# Altium schematic sheet Controller-Sheet.SchDoc
size A4; DocumentNumber: 6; SheetNumber: 6; SheetTotal: 8
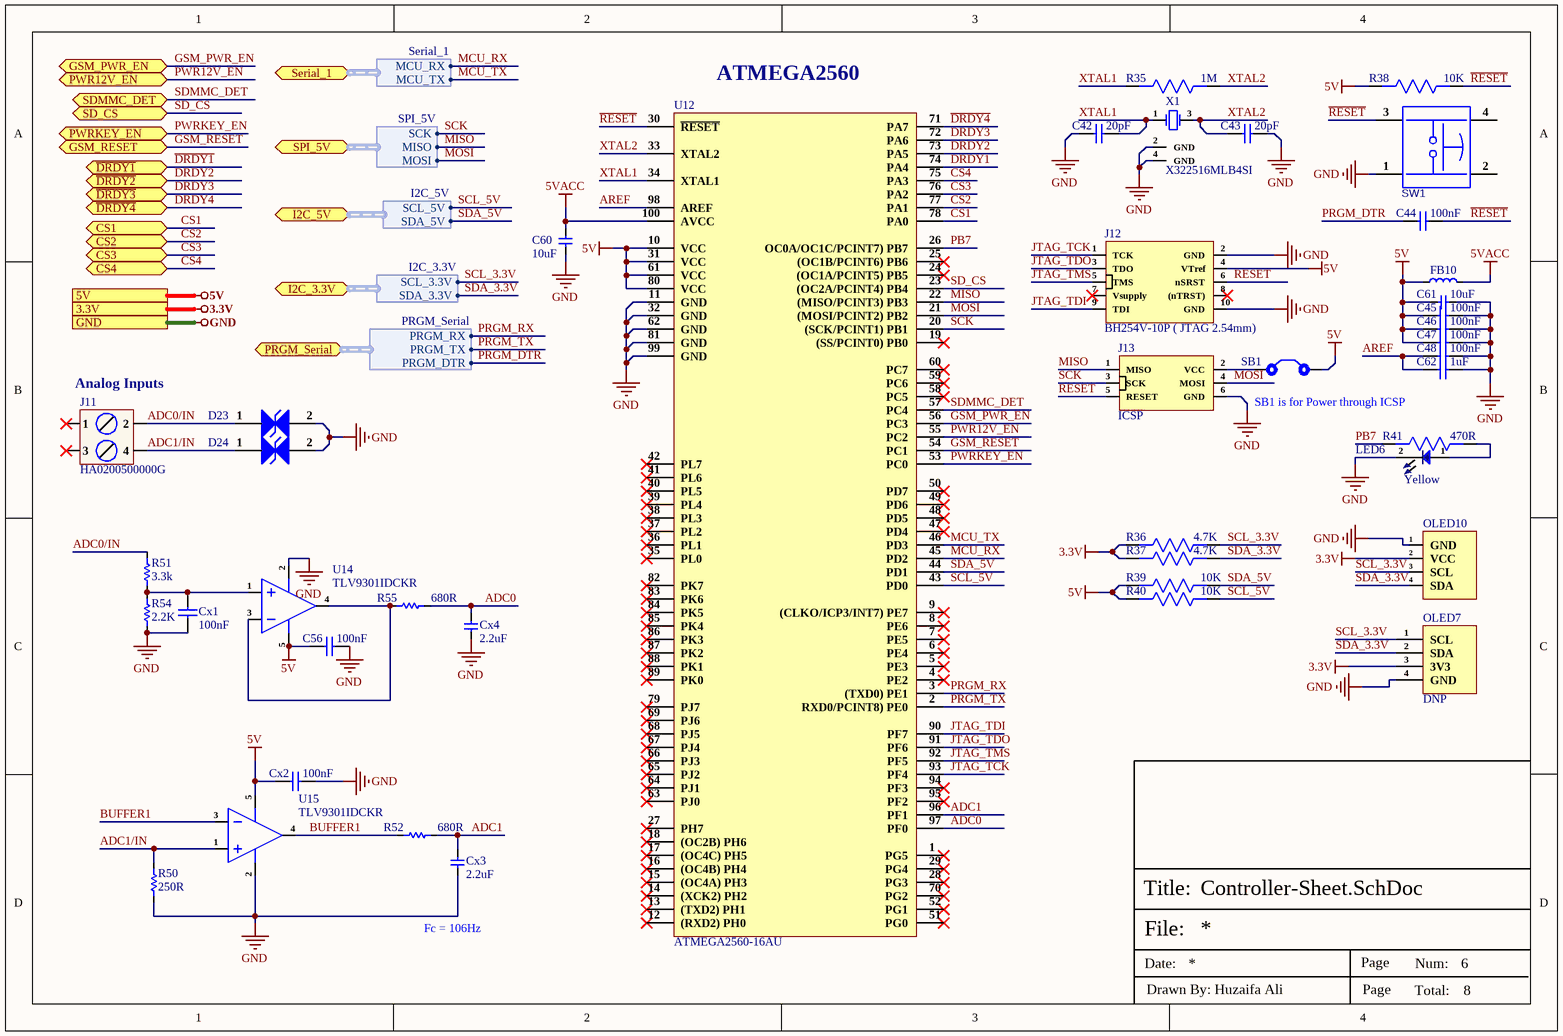
[diagram p0: Controller-Sheet.SchDoc]

## Parts
C42  20pF  [Cap-0603]
C43  20pF  [Cap-0603]
C44  100nF  [Cap-0603]
C45  100nF  [Cap-0603]
C46  100nF  [Cap-0603]
C47  100nF  [Cap-0603]
C48  100nF  [Cap-0603]
C56  100nF  [Cap-0603]
C60  10uF  [Cap-0603]
C61  10uF  [Cap-0603]
C62  1uF  [Cap-0603]
Cx1  100nF  [Cap-0603]
Cx2  100nF  [Cap-0603]
Cx3  2.2uF  [Cap-0805]
Cx4  2.2uF  [Cap-0805]
D23  PGB1010402KR  [Diode 0402]  (value not drawn)
D24  PGB1010402KR  [Diode 0402]  (value not drawn)
FB10  BLM15PD121SN1D  [IND-0402]  (value not drawn)
J11  HA0200500000G  [HA0200500000G]
J12  BH254V-10P ( JTAG 2.54mm)  [BH254V-10P]
J13  ICSP  [BH254V-6P]
LED6  Yellow  [LED-0603]
OLED7  DNP  [ZIO-101954]
OLED10  OLED 0.96" inch i2C  [OLED 0.96" inch i2C]  (value not drawn)
R35  1M  [Res-0603]
R36  4.7K  [Res-0603]
R37  4.7K  [Res-0603]
R38  10K  [Res-0603]
R39  10K  [Res-0603]
R40  10K  [Res-0603]
R41  470R  [Res-0603]
R50  250R  [Res-1206]
R51  3.3k  [Res-0603]
R52  680R  [Res-0603]
R54  2.2K  [Res-0603]
R55  680R  [Res-0603]
SB1  Solder Bridge  [Solder Bridge]  (value not drawn)
SW1  Tactile Switch  [TL3301NF160QG]  (value not drawn)
U12  ATMEGA2560-16AU  [TQFP-100(14x14)]
U14  TLV9301IDCKR  [SC-70-5]
U15  TLV9301IDCKR  [SC-70-5]
X1  X322516MLB4SI  [SMD3225-4P]

## Ports
3.3V, 5V, CS1 (bidir), CS2 (bidir), CS3 (bidir), CS4 (bidir), GND, GSM_PWR_EN (bidir), GSM_RESET (bidir), I2C_3.3V (bidir, harness I2C_3.3V), I2C_5V (bidir, harness I2C_5V), PRGM_Serial (bidir, harness PRGM_Serial), PWR12V_EN (bidir), PWRKEY_EN (bidir), SD_CS (bidir), SDMMC_DET (bidir), Serial_1 (bidir, harness Serial_1), SPI_5V (bidir, harness SPI_5V), ~{DRDY1} (bidir), ~{DRDY2} (bidir), ~{DRDY3} (bidir), ~{DRDY4} (bidir)

## Harnesses
I2C_3.3V: SCL_3.3V, SDA_3.3V
I2C_5V: SCL_5V, SDA_5V
SPI_5V: SCK, MISO, MOSI
PRGM_Serial: PRGM_RX, PRGM_TX, PRGM_DTR
Serial_1: MCU_RX, MCU_TX

## Nets
3.3V: OLED7.3(3V3) OLED10.2(VCC) R36.2 R37.2 ; port 3.3V
5V: C45.1 C46.1 C47.1 C56.1 C61.2 Cx2.1 FB10.1 J12.4(VTref) R38.2 R39.2 R40.2 SB1.2 U12.10(VCC) U12.31(VCC) U12.61(VCC) U12.80(VCC) U14.5(V+) U15.5(V+) ; port 5V
5VACC: C60.1 FB10.2 U12.100(AVCC)
GND: C42.1 C43.2 C45.2 C46.2 C47.2 C48.2 C56.2 C60.2 C61.1 C62.2 Cx1.1 Cx2.2 Cx3.1 Cx4.1 D23.2 D24.2 J12.2(GND) J12.10(GND) J13.6(GND) LED6.2 OLED7.4(GND) OLED10.1(GND) R50.1 R54.1 SW1.1 U12.11(GND) U12.32(GND) U12.62(GND) U12.81(GND) U12.99(GND) U14.2(V-) U15.2(V-) X1.2(GND) X1.4(GND) ; port GND
ADC0: Cx4.2 R55.2 U12.97(PF0)
ADC0/IN: D23.1 J11.2 R51.2
ADC1: Cx3.2 R52.2 U12.96(PF1)
ADC1/IN: D24.1 J11.4 R50.2 U15.1(IN+)
AREF: C48.1 C62.1 U12.98(AREF)
BUFFER1: R52.1 U15.3(IN-) U15.4(OUT)
CS1: U12.78(PA0) ; port CS1
CS2: U12.77(PA1) ; port CS2
CS3: U12.76(PA2) ; port CS3
CS4: U12.75(PA3) ; port CS4
~{DRDY1}: U12.74(PA4) ; port ~{DRDY1}
~{DRDY2}: U12.73(PA5) ; port ~{DRDY2}
~{DRDY3}: U12.72(PA6) ; port ~{DRDY3}
~{DRDY4}: U12.71(PA7) ; port ~{DRDY4}
GSM_PWR_EN: U12.56(PC3) ; port GSM_PWR_EN
GSM_RESET: U12.54(PC1) ; port GSM_RESET
JTAG_TCK: J12.1(TCK) U12.93(PF4)
JTAG_TDI: J12.9(TDI) U12.90(PF7)
JTAG_TDO: J12.3(TDO) U12.91(PF6)
JTAG_TMS: J12.5(TMS) U12.92(PF5)
MCU_RX: U12.45(PD2) ; port Serial_1.MCU_RX
MCU_TX: U12.46(PD3) ; port Serial_1.MCU_TX
MISO: J13.1(MISO) U12.22((MISO/PCINT3)_PB3) ; port SPI_5V.MISO
MOSI: J13.4(MOSI) U12.21((MOSI/PCINT2)_PB2) ; port SPI_5V.MOSI
PB7: R41.2 U12.26(OC0A/OC1C/PCINT7)_PB7)
PRGM_DTR: C44.1 ; port PRGM_Serial.PRGM_DTR
PRGM_RX: U12.3((TXD0)_PE1) ; port PRGM_Serial.PRGM_RX
PRGM_TX: U12.2(RXD0/PCINT8)_PE0) ; port PRGM_Serial.PRGM_TX
PWR12V_EN: U12.55(PC2) ; port PWR12V_EN
PWRKEY_EN: U12.53(PC0) ; port PWRKEY_EN
~{RESET}: C44.2 J12.6(nSRST) J13.5(RESET) R38.1 SW1.3 U12.30(~{RESET})
SCK: J13.3(SCK) U12.20((SCK/PCINT1)_PB1) ; port SPI_5V.SCK
SCL_3.3V: OLED7.1(SCL) OLED10.3(SCL) R36.1 ; port I2C_3.3V.SCL_3.3V
SCL_5V: R40.1 U12.43(PD0) ; port I2C_5V.SCL_5V
SD_CS: U12.23((OC2A/PCINT4)_PB4) ; port SD_CS
SDA_3.3V: OLED7.2(SDA) OLED10.4(SDA) R37.1 ; port I2C_3.3V.SDA_3.3V
SDA_5V: R39.1 U12.44(PD1) ; port I2C_5V.SDA_5V
SDMMC_DET: U12.57(PC4) ; port SDMMC_DET
XTAL1: C42.2 R35.2 U12.34(XTAL1) X1.1(CRYSTAL)
XTAL2: C43.1 R35.1 U12.33(XTAL2) X1.3(CRYSTAL)
NetCx1_2: Cx1.2 R51.1 R54.2 U14.1(IN+)
NetJ13_2: J13.2(VCC) SB1.1
NetLED6_1: LED6.1 R41.1
NetR55_1: R55.1 U14.3(IN-) U14.4(OUT)

Not connected (* = marked no-connect by the designer): J11 1* 3*; J12 7(Vsupply)* 8((nTRST))*; SW1 2 4; U12 1(PG5)* 4(PE2)* 5(PE3)* 6(PE4)* 7(PE5)* 8(PE6)* 9((CLKO/ICP3/INT7)_PE7)* 12((RXD2)_PH0)* 13((TXD2)_PH1)* 14((XCK2)_PH2)* 15((OC4A)_PH3)* 16((OC4B)_PH4)* 17((OC4C)_PH5)* 18((OC2B)_PH6)* 19((SS/PCINT0)_PB0)* 24((OC1A/PCINT5)_PB5)* 25((OC1B/PCINT6)_PB6)* 27(PH7)* 28(PG3)* 29(PG4)* 35(PL0)* 36(PL1)* 37(PL2)* 38(PL3)* 39(PL4)* 40(PL5)* 41(PL6)* 42(PL7)* 47(PD4)* 48(PD5)* 49(PD6)* 50(PD7)* 51(PG0)* 52(PG1)* 58(PC5)* 59(PC6)* 60(PC7)* 63(PJ0)* 64(PJ1)* 65(PJ2)* 66(PJ3)* 67(PJ4)* 68(PJ5)* 69(PJ6)* 70(PG2)* 79(PJ7)* 82(PK7)* 83(PK6)* 84(PK5)* 85(PK4)* 86(PK3)* 87(PK2)* 88(PK1)* 89(PK0)* 94(PF3)* 95(PF2)*

## Notes on the sheet
- (near U12) ATMEGA2560
- (near J11) Analog Inputs
- SB1 is for Power through ICSP
- Fc = 106Hz
- File:
- Title:
- Date:
- Page
- Num:
- Total:
- Drawn By: Huzaifa Ali

## Library data of the parts
C42 C43 = CC0603JRNPO9BN200: CAP CER 20PF 50V C0G/NPO 0603; Manufacturer: Yageo; Tolerance: 5%; Dielectric: C0G; Supplier 1: Digi-Key; Manufacturer Part Number: CC0603JRNPO9BN200; Stock 1: 259568; Pricing 1: 1=0.1, 10=0.048, 100=0.0214, 500=0.01526, 1000=0.01198 (USD); Mount: Surface Mount; Case/Package: 0603; Number of Pins: 2; Weight: 7.1E-05oz; Case Code (Imperial): 0603; Case Code (Metric): 1608; Min Operating Temperature: -55°C; Max Operating Temperature: 125°C; Capacitance: 20pF; Package Quantity: 4000; Voltage Rating (DC): 50V; Packaging: Tape and Reel; Voltage Rating: 50V; Termination: SMD/SMT; Composition: Ceramic; Length: 1.6mm; Width: 0.8mm; Thickness: 0.035inch; Depth: 0.8mm; REACH SVHC: Unknown; Lead Free: Lead Free; ComponentLink1URL: http://www.farnell.com/datasheets/1132289.pdf?src-supplier=Element14; ComponentLink1Description: http://www.farnell.com/datasheets/1132289.pdf?src-supplier=Element14; ComponentLink2URL: http://www.yageo.com/documents/recent/UPY-GP_NP0_16V-to-50V_16.pdf?src-supplier=Digi-Key; ComponentLink2Description: http://www.yageo.com/documents/recent/UPY-GP_NP0_16V-to-50V_16.pdf?src-supplier=Digi-Key; Supplier Part Number 1: 311-1424-6-ND; LCSC Part Number: C105621
C44-C48 C56 Cx1 Cx2 = CC0603KRX5R9BB104: CAP CER 0.1UF 50V X5R 0603; Manufacturer: Yageo; Tolerance: 10%; Item Type: Capacitor; Supplier 1: Digi-Key; Manufacturer Part Number: CC0603KRX5R9BB104; RoHS: Yes; Category: Ceramic Capacitors; Stock 1: 152253; Pricing 1: 1=0.10000, 10=0.05200, 50=0.02820, 100=0.02310, 500=0.01648, 1000=0.01294 (USD); Mount: Surface Mount; Case/Package: 0603; Case Code (Imperial): 0603; Case Code (Metric): 1608; Weight: 7.1E-05oz; Min Operating Temperature: -55°C; Max Operating Temperature: 85°C; Capacitance: 100nF; Packaging: Tape and Reel; Voltage Rating: 50V; Dielectric: X5R; Termination: SMD/SMT; Voltage Rating (DC): 50V; Package Quantity: 4000; Length: 0.063inch; Width: 0.031inch; Thickness: 0.035inch; Lead Free: Lead Free; Halogen Free: Halogen Free; ComponentLink1URL: http://www.mouser.com/ds/2/447/Yageo_UPY-GP_NP0_16V-to-50V_9-358835.pdf?src-supplier=Mouser; ComponentLink1Description: http://www.mouser.com/ds/2/447/Yageo_UPY-GP_NP0_16V-to-50V_9-358835.pdf?src-supplier=Mouser; ComponentLink2URL: https://www.yageo.com/upload/media/product/productsearch/datasheet/mlcc/UPY-GPHC_X5R_4V-to-50V_26.pdf?src-supplier=Digi-Key; ComponentLink2Description: https://www.yageo.com/upload/media/product/productsearch/datasheet/mlcc/UPY-GPHC_X5R_4V-to-50V_26.pdf?src-supplier=Digi-Key; ComponentLink3URL: http://www.yageo.com/exep/pages/download/literatures/ProductSelectionGuide%202014_Final_2.pdf?src-supplier=Digi-Key; ComponentLink3Description: http://www.yageo.com/exep/pages/download/literatures/ProductSelectionGuide%202014_Final_2.pdf?src-supplier=Digi-Key; Supplier Part Number 1: 311-4046-1-ND; LCSC Part Number: C110022
C60 C61 = CC0603KRX5R7BB106: CAP CER 10UF 16V X5R 0603; Manufacturer: Yageo; Tolerance: 10%; Item Type: Capacitor; Supplier 1: Digi-Key; Manufacturer Part Number: CC0603KRX5R7BB106; RoHS: Yes; Category: Ceramic Capacitors; Stock 1: 240725; Pricing 1: 1=0.68000, 10=0.48000, 50=0.36300, 100=0.31610, 500=0.23416, 1000=0.19903 (USD); Mount: Surface Mount; Case/Package: 0603; Case Code (Imperial): 0603; Case Code (Metric): 1608; Min Operating Temperature: -55°C; Max Operating Temperature: 85°C; Packaging: Cut Tape; Capacitance: 10uF; Voltage Rating: 16V; RoHS Compliant: Yes; ComponentLink1URL: http://www.yageo.com/documents/recent/UPY-GPHC_X5R_4V-to-50V_25.pdf?src-supplier=Digi-Key; ComponentLink1Description: http://www.yageo.com/documents/recent/UPY-GPHC_X5R_4V-to-50V_25.pdf?src-supplier=Digi-Key; Supplier Part Number 1: 311-3486-1-ND; LCSC Part Number: C2936601
C62 = CC0603KRX5R8BB105: CAP CER 1UF 25V X5R 0603; Manufacturer: Yageo; Tolerance: 10%; Item Type: Capacitor; Supplier 1: Digi-Key; Manufacturer Part Number: CC0603KRX5R8BB105; RoHS: Yes; Category: Ceramic Capacitors; Stock 1: 919939; Pricing 1: 1=0.12000, 10=0.08400, 50=0.04760, 100=0.03940, 500=0.02764, 1000=0.02288 (USD); Mount: Surface Mount; Case/Package: 0603; Number of Pins: 2; Case Code (Metric): 1608; Case Code (Imperial): 0603; Min Operating Temperature: -55°C; Max Operating Temperature: 85°C; Capacitance: 1uF; Dielectric: X5R; Package Quantity: 1; Voltage Rating: 25V; Packaging: Tape and Reel; Termination: SMD/SMT; Voltage Rating (DC): 25V; Series: CC; Construction: Flat; Length: 1.6mm; Width: 0.031inch; Height: 0.8mm; Thickness: 0.035inch; Depth: 0.8mm; Radiation Hardening: No; REACH SVHC: No SVHC; Lead Free: Lead Free; Halogen Free: Halogen Free; RoHS Compliant: Yes; ComponentLink1URL: https://datasheet.ciiva.com/176/mlccorderingcode-176785.pdf?src-supplier=Digi-Key; ComponentLink1Description: https://datasheet.ciiva.com/176/mlccorderingcode-176785.pdf?src-supplier=Digi-Key; ComponentLink2URL: https://datasheet.ciiva.com/176/mlccorderingcode-176786.pdf?src-supplier=Digi-Key; ComponentLink2Description: https://datasheet.ciiva.com/176/mlccorderingcode-176786.pdf?src-supplier=Digi-Key; ComponentLink3URL: https://datasheet.ciiva.com/176/mlccorderingcode-176787.pdf?src-supplier=Digi-Key; ComponentLink3Description: https://datasheet.ciiva.com/176/mlccorderingcode-176787.pdf?src-supplier=Digi-Key; ComponentLink4URL: https://datasheet.ciiva.com/17436/upy-gphc-x5r-4v-to-50v-12-17436952.pdf?src-supplier=Avnet+Europe; ComponentLink4Description: https://datasheet.ciiva.com/17436/upy-gphc-x5r-4v-to-50v-12-17436952.pdf?src-supplier=Avnet+Europe; ComponentLink5URL: https://datasheet.ciiva.com/7978/1525783-7978171.pdf?src-supplier=Element14; ComponentLink5Description: https://datasheet.ciiva.com/7978/1525783-7978171.pdf?src-supplier=Element14; ComponentLink6URL: https://datasheet.ciiva.com/11586/upy-gphc-x5r-4v-to-50v-12-11586318.pdf?src-supplier=Avnet; ComponentLink6Description: https://datasheet.ciiva.com/11586/upy-gphc-x5r-4v-to-50v-12-11586318.pdf?src-supplier=Avnet; Supplier Part Number 1: 311-1445-1-ND; LCSC Part Number: C14664
Cx3 Cx4 = CC0805KKX5R9BB225: CAP CER 2.2UF 50V X5R 0805; Manufacturer: Yageo; Tolerance: 10%; Item Type: Capacitor; Supplier 1: Mouser; Manufacturer Part Number: CC0805KKX5R9BB225; RoHS: Yes; Category: Ceramic Capacitors; Stock 1: 3880; Pricing 1: 1=0.26000, 10=0.12100, 50=0.12100, 100=0.08700, 1000=0.06700, 10000=0.05000 (USD); Mounting Technology: Surface Mount; Case/Package: 0805; Case Code (Metric): 2012; Case Code (Imperial): 0805; Weight: 0.000194oz; Min Operating Temperature: -55°C; Max Operating Temperature: 85°C; Packaging: Tape and Reel; Value: 2.2uF; Voltage Rating: 50V; Dielectric: X5R; Termination: SMD/SMT; Resistor Type: Ceramic; Voltage Rating (DC): 50V; Package Quantity: 3000; Length: 0.079inch; Width: 1.25mm; Thickness: 0.057inch; Lead Free: Lead Free; Halogen Free: Halogen Free; RoHS Compliant: Yes; ComponentLink1URL: http://www.mouser.com/ds/2/447/Yageo_UPY-GP_NP0_16V-to-50V_9-358835.pdf?src-supplier=Mouser; ComponentLink1Description: http://www.mouser.com/ds/2/447/Yageo_UPY-GP_NP0_16V-to-50V_9-358835.pdf?src-supplier=Mouser; ComponentLink2URL: http://www.yageo.com/documents/recent/UPY-GPHC_X5R_4V-to-50V_25.pdf?src-supplier=Digi-Key; ComponentLink2Description: http://www.yageo.com/documents/recent/UPY-GPHC_X5R_4V-to-50V_25.pdf?src-supplier=Digi-Key; Supplier Part Number 1: 603-CC805KKX5R9BB225; LCSC Part Number: C326581
D23 D24 = PGB1010402KR: TVS DIODE 12VWM 250VC 0402; Manufacturer: Littelfuse; Direction: Bidirectional; Capacitance: 0.04pF; Number of Channels: 1; Reverse Standoff Voltage: 12V; Clamping Voltage: 250V; Power Line Protection: No; Leakage Current: 1nA; Element Configuration: Single; Diode Type: ZENER; Response Time: 1ns; Supplier 1: Arrow Electronics; Manufacturer Part Number: PGB1010402KR; RoHS: Yes; Category: TVS Diodes; Stock 1: 30000; Pricing 1: 10000=0.23580, 20000=0.23350, 30000=0.23120, 40000=0.22890, 50000=0.21590, 100000=0.20590 (USD); Mount: Surface Mount; Case/Package: 0402; Number of Pins: 2; Case Code (Metric): 1005; Case Code (Imperial): 0402; Min Operating Temperature: -65°C; Max Operating Temperature: 125°C; Packaging: Cut Tape; Number of Bidirectional Channels: 1; Termination: SMD/SMT; Working Voltage: 12V; Operating Supply Voltage: 12V; Resistor Type: Zener; Series: PulseGuard® PGB; Voltage Rating: 12V; Polarity: Bidirectional; Number of Elements: 1; Voltage Rating (DC): 12V; Length: 1.66mm; Height: 0.31mm; Depth: 0.51mm; Radiation Hardening: No; Lead Free: Lead Free; RoHS Compliant: Yes; Reach SVHC Compliant: Yes; ComponentLink1URL: https://datasheet.ciiva.com/1268/1486684-1268416.pdf?src-supplier=Element14; ComponentLink1Description: https://datasheet.ciiva.com/1268/1486684-1268416.pdf?src-supplier=Element14; ComponentLink2URL: https://datasheet.ciiva.com/5837/575761-5837954.pdf?src-supplier=Farnell; ComponentLink2Description: https://datasheet.ciiva.com/5837/575761-5837954.pdf?src-supplier=Farnell; ComponentLink3URL: https://datasheet.ciiva.com/11804/0900766b80f9ec73-11804302.pdf?src-supplier=RSComponents; ComponentLink3Description: https://datasheet.ciiva.com/11804/0900766b80f9ec73-11804302.pdf?src-supplier=RSComponents; ComponentLink4URL: https://datasheet.ciiva.com/1268/575761-1268268.pdf?src-supplier=Element14; ComponentLink4Description: https://datasheet.ciiva.com/1268/575761-1268268.pdf?src-supplier=Element14; ComponentLink5URL: https://datasheet.ciiva.com/331/littelfuse-pulseguard-esd-pgb1-331746.pdf?src-supplier=Digi-Key; ComponentLink5Description: https://datasheet.ciiva.com/331/littelfuse-pulseguard-esd-pgb1-331746.pdf?src-supplier=Digi-Key; ComponentLink6URL: https://datasheet.ciiva.com/331/littelfuse-pulseguard-esd-pgb1-331747.pdf?src-supplier=Digi-Key; ComponentLink6Description: https://datasheet.ciiva.com/331/littelfuse-pulseguard-esd-pgb1-331747.pdf?src-supplier=Digi-Key; ComponentLink7URL: https://datasheet.ciiva.com/331/littelfuse-pulseguard-esd-pgb1-331745.pdf?src-supplier=Digi-Key; ComponentLink7Description: https://datasheet.ciiva.com/331/littelfuse-pulseguard-esd-pgb1-331745.pdf?src-supplier=Digi-Key; ComponentLink8URL: https://datasheet.ciiva.com/26917/getdatasheetpartid-250436-26917930.pdf?src-supplier=Verical; ComponentLink8Description: https://datasheet.ciiva.com/26917/getdatasheetpartid-250436-26917930.pdf?src-supplier=Verical; Supplier Part Number 1: PGB1010402KR; LCSC Part Number: C10676; Item Type: Diode
FB10 = BLM15PD121SN1D: FERRITE BEAD 120 OHM 0402 1LN; Manufacturer: Murata; Material: Steel,Ferrite; Tolerance: 25%; Impedance: 120R; Current Rating: 1.3A; Number of Lines: 1; DC Resistance (DCR): 90mR; Test Frequency: 100MHz; Supplier 1: Avnet; Manufacturer Part Number: BLM15PD121SN1D; RoHS: Yes; Category: Ferrite Beads and Chips; Stock 1: 300000; Pricing 1: 10000=0.03238, 20000=0.03063, 40000=0.02888, 60000=0.02713, 80000=0.02538, 100000=0.02363, 1000000=0.02188 (USD); Case/Package: 0402; Number of Pins: 2; Core Material: Ferrite; Case Code (Metric): 1005; Case Code (Imperial): 0402; Min Operating Temperature: -55°C; Max Operating Temperature: 125°C; Package Quantity: 1; Packaging: Tape and Reel; Max Current Rating: 1.3A; Termination: SMD/SMT; Max DC Current: 1.3A; DC Current: 1.3A; Number of Circuits: 1; Series: BLM15PD; DC Resistance-Max: 90mR; Length: 1mm; Width: 0.5mm; Height: 0.5mm; Depth: 0.55mm; Radiation Hardening: No; Reach SVHC Compliant: Yes; Military Standard: Not; Lead Free: Lead Free; RoHS Compliant: Yes; ComponentLink1URL: https://datasheet.ciiva.com/11800/0900766b811b5866-11800860.pdf?src-supplier=RSComponents; ComponentLink1Description: https://datasheet.ciiva.com/11800/0900766b811b5866-11800860.pdf?src-supplier=RSComponents; ComponentLink2URL: https://datasheet.ciiva.com/18093/getdatasheetpartid-195858-18093157.pdf?src-supplier=Verical; ComponentLink2Description: https://datasheet.ciiva.com/18093/getdatasheetpartid-195858-18093157.pdf?src-supplier=Verical; ComponentLink3URL: https://datasheet.ciiva.com/41425/001171686-da-01-en-chip-drossel0402-120r-1300ma-1-0x0-5mm-41425776.pdf?src-supplier=Conrad; ComponentLink3Description: https://datasheet.ciiva.com/41425/001171686-da-01-en-chip-drossel0402-120r-1300ma-1-0x0-5mm-41425776.pdf?src-supplier=Conrad; ComponentLink4URL: https://datasheet.ciiva.com/41449/001172205-da-01-en-drossel-0402-120r-11-0x0-5mm-10000st-41449495.pdf?src-supplier=Conrad; ComponentLink4Description: https://datasheet.ciiva.com/41449/001172205-da-01-en-drossel-0402-120r-11-0x0-5mm-10000st-41449495.pdf?src-supplier=Conrad; ComponentLink5URL: https://datasheet.ciiva.com/1012/l0110e-1012435.pdf?src-supplier=Digi-Key; ComponentLink5Description: https://datasheet.ciiva.com/1012/l0110e-1012435.pdf?src-supplier=Digi-Key; ComponentLink6URL: https://datasheet.ciiva.com/1012/l0110e-1012434.pdf?src-supplier=Digi-Key; ComponentLink6Description: https://datasheet.ciiva.com/1012/l0110e-1012434.pdf?src-supplier=Digi-Key; ComponentLink7URL: https://datasheet.ciiva.com/1012/l0110e-1012436.pdf?src-supplier=Digi-Key; ComponentLink7Description: https://datasheet.ciiva.com/1012/l0110e-1012436.pdf?src-supplier=Digi-Key; Supplier Part Number 1: BLM15PD121SN1D; LCSC Part Number: C76891; Item Type: Ferrite Bead
J11 = HA0200500000G: TERM BLK 2POS TOP ENT 5.08MM PCB; Manufacturer: Amphenol; Item Type: Terminal Block; Supplier 1: Arrow Electronics; Manufacturer Part Number: HA0200500000G; RoHS: Yes; Stock 1: 120; Pricing 1: 2160=0.34600, 2520=0.34400, 3600=0.29460, 9000=0.29270, 18000=0.29070, 45000=0.28890, 90000=0.28680 (USD); Terminal and Terminal Block Type: BARRIER STRIP TERMINAL BLOCK; RoHS Compliant: Yes; Reach SVHC Compliant: Yes; ComponentLink1URL: https://datasheet.ciiva.com:443/pdfs/VipMasterIC/IC/AMPH/AMPH-S-A0005047712/AMPH-S-A0005047712-1.pdf?src-supplier=IHS+Markit; ComponentLink1Description: https://datasheet.ciiva.com:443/pdfs/VipMasterIC/IC/AMPH/AMPH-S-A0005047712/AMPH-S-A0005047712-1.pdf?src-supplier=IHS+Markit; Supplier Part Number 1: HA0200500000G; LCSC Part Number: C967080
J12 = BH254V-10P ( JTAG 2.54mm): 2.54mm -40℃~+105℃ Straight 3A 250V 5 Push - Pull 2.54mm 2 Plugin,P=2.54mm IDC Connectors ROHS; Manufacturer: XFCN; Manufacturer Part Number: BH254V-10P; Package: Plugin,P=2.54mm; LCSC Part Number: C492442; Item Type: Connector; ComponentLink1Description: LCSC; ComponentLink1URL: https://www.lcsc.com/product-detail/IDC-Connectors_XFCN-BH254V-10P_C492442.html
J13 = BH254V-6P ( 6-ICSP 2.54mm): 2.54mm -40℃~+105℃ Straight 3A 250V 3 Push - Pull 2.54mm 2 Plugin,P=2.54mm IDC Connectors ROHS; Manufacturer: XFCN; Manufacturer Part Number: BH254V-6P; Package: Plugin,P=2.54mm; LCSC Part Number: C492441; Item Type: Connector; ComponentLink1Description: LCSC; ComponentLink1URL: *https://www.lcsc.com/product-detail/IDC-Connectors_XFCN-BH254V-6P_C492441.html
LED6 = 19-21/G6C-FM1N2B/3T: Yellow-Green 572nm LED Indication - Discrete 2.05V 0603 (1608 Metric); Manufacturer: Everlight Elec; Manufacturer Part Number: 19-21/G6C-FM1N2B/3T; Package: 0603; LCSC Part Number: C93689; Item Type: LED; ComponentLink1Description: LCSC; ComponentLink1URL: https://www.lcsc.com/product-detail/Light-Emitting-Diodes-LED_Everlight-Elec-19-21-G6C-FM1N2B-3T_C93689.html
OLED7 = ZIO-101954: ZIO QWIIC 1.5INCH OLED DISPLAY; Manufacturer: Smart Prototyping; Item Type: OLED Module; Manufacturer Part Number: ZIO-101954; Package: Custom; LCSC Part Number: *; ComponentLink1Description: Digikey; ComponentLink1URL: https://www.digikey.com/en/products/detail/smart-prototyping/ZIO-101954/14565832
OLED10 = OLED 0.96" inch i2C: 0.96 Inch OLED SSD1306 White/Blue/Yellow 128X64 IIC I2C Serial Display Module 12864 LCD Screen Board For Arduino; Manufacturer: TENSTAR ROBOT; Item Type: OLED Module; Manufacturer Part Number: OLED 0.96" inch i2C; Package: Custom; ComponentLink1Description: Aliexpress; ComponentLink1URL: https://vi.aliexpress.com/item/32643950109.html?gatewayAdapt=glo2vnm
R35 = RC0603FR-071ML: RES SMD 1M OHM 1% 1/10W 0603; Manufacturer: Yageo; Voltage Rating: 50V; Resistance: 1MR; Power Rating: 100mW; Temperature Coefficient: 100ppm/°C; Supplier 1: Digi-Key; Manufacturer Part Number: RC0603FR-071ML; Stock 1: 3824601; Pricing 1: 1=0.1, 10=0.023, 100=0.0094, 1000=0.00421, 2500=0.00366 (USD); Case/Package: 0603; Number of Pins: 2; Case Code (Imperial): 0603; Case Code (Metric): 1608; Min Operating Temperature: -55°C; Max Operating Temperature: 155°C; Voltage Rating (DC): 50V; Tolerance: 1%; Packaging: Tape and Reel; Package Quantity: 5000; Termination: SMD/SMT; Composition: Thick Film; Military Standard: Not; Length: 1.6mm; Height: 0.45mm; Width: 0.8mm; Depth: 0.8mm; REACH SVHC: No SVHC; Lead Free: Lead Free; ComponentLink1URL: http://www.farnell.com/datasheets/2167052.pdf?src-supplier=Mouser; ComponentLink1Description: http://www.farnell.com/datasheets/2167052.pdf?src-supplier=Mouser; ComponentLink2URL: http://www.farnell.com/datasheets/2167052.pdf?src-supplier=Element14; ComponentLink2Description: http://www.farnell.com/datasheets/2167052.pdf?src-supplier=Element14; ComponentLink3URL: http://documents.rs-components.com/techlib://itc_doclist_GB.htm?stockno=5048956&src-supplier=RSComponents; ComponentLink3Description: http://documents.rs-components.com/techlib://itc_doclist_GB.htm?stockno=5048956&src-supplier=RSComponents; Supplier Part Number 1: 311-1.00MHRDKR-ND; LCSC Part Number: C105578
R36 R37 = RC0603JR-074K7L: RES SMD 4.7K OHM 5% 1/10W 0603; Manufacturer: Yageo; Resistance: 4.7kR; Temperature Coefficient: 100ppm/°C; Voltage Rating (DC): 50V; Power Rating: 100mW; Supplier 1: Digi-Key; Manufacturer Part Number: RC0603JR-074K7L; Stock 1: 19706643; Pricing 1: 1=0.1, 10=0.02, 100=0.0081, 1000=0.00362, 2500=0.00314 (USD); Case/Package: 0603; Number of Pins: 2; Case Code (Imperial): 0603; Case Code (Metric): 1608; Min Operating Temperature: -55°C; Max Operating Temperature: 155°C; Tolerance: 5%; Composition: Thick Film; Packaging: Tape and Reel; Voltage Rating: 50V; Termination: SMD/SMT; Military Standard: Not; Length: 1.6mm; Width: 0.8mm; Depth: 0.8mm; REACH SVHC: No SVHC; Lead Free: Lead Free; ComponentLink1URL: http://www.farnell.com/datasheets/443971.pdf?src-supplier=Element14; ComponentLink1Description: http://www.farnell.com/datasheets/443971.pdf?src-supplier=Element14; Supplier Part Number 1: 311-4.7KGRCT-ND; LCSC Part Number: C105428
R38-R40 = RC0603FR-0710KL: RES SMD 10K Ohm 1% 1/10W 0603; Manufacturer: Yageo; Resistance: 10kR; Temperature Coefficient: 100ppm/°C; Voltage Rating (DC): 50V; Power Rating: 100mW; Voltage Rating: 75V; Supplier 1: Digi-Key; Manufacturer Part Number: RC0603FR-0710KL; RoHS: Yes; Category: Chip SMD Resistors; Stock 1: 25249139; Pricing 1: 1=0.10000, 10=0.02400, 100=0.00970, 1000=0.00436, 2500=0.00378 (USD); Case/Package: 0603; Number of Pins: 2; Case Code (Imperial): 0603; Case Code (Metric): 1608; Weight: 7.1E-05oz; Size Code: 0603; Min Operating Temperature: -55°C; Max Operating Temperature: 155°C; Tolerance: 1%; Resistor Type: Thick Film; Packaging: Tape and Reel; Termination: SMD/SMT; Features: Moisture Resistant; Series: RC; Max Power Dissipation: 100mW; Number of Terminations: 2; Resistance Tolerance: 1%; Construction: Rectangular; Length: 1.6mm; Width: 0.8mm; Height: 0.45mm; Depth: 0.8mm; Lead Pitch: 0.3mm; REACH SVHC: Unknown; Lead Free: Lead Free; Military Standard: Not; RoHS Compliant: Yes; ComponentLink1URL: https://datasheet.ciiva.com/7660/38590-7660789.pdf?src-supplier=Element14; ComponentLink1Description: https://datasheet.ciiva.com/7660/38590-7660789.pdf?src-supplier=Element14; ComponentLink2URL: https://datasheet.ciiva.com/7983/443971-7983596.pdf?src-supplier=Element14; ComponentLink2Description: https://datasheet.ciiva.com/7983/443971-7983596.pdf?src-supplier=Element14; ComponentLink3URL: https://datasheet.ciiva.com/22747/443971-22747519.pdf?src-supplier=Element14; ComponentLink3Description: https://datasheet.ciiva.com/22747/443971-22747519.pdf?src-supplier=Element14; ComponentLink4URL: https://datasheet.ciiva.com/46440/1868787-46440891.pdf?src-supplier=Element14; ComponentLink4Description: https://datasheet.ciiva.com/46440/1868787-46440891.pdf?src-supplier=Element14; ComponentLink5URL: https://datasheet.ciiva.com/7746/1738695-7746239.pdf?src-supplier=Element14; ComponentLink5Description: https://datasheet.ciiva.com/7746/1738695-7746239.pdf?src-supplier=Element14; ComponentLink6URL: https://datasheet.ciiva.com/15189/getdatasheetpartid-409289-15189591.pdf?src-supplier=Verical; ComponentLink6Description: https://datasheet.ciiva.com/15189/getdatasheetpartid-409289-15189591.pdf?src-supplier=Verical; Supplier Part Number 1: 311-10.0KHRCT-ND; LCSC Part Number: C98220
R41 = RC0603FR-07470RL: RES 470 OHM 1% 1/10W 0603; Manufacturer: Yageo; Power Rating: 100mW; Voltage Rating: 50V; Temperature Coefficient: 100ppm/°C; Working Voltage: 75V; Supplier 1: Digi-Key; Manufacturer Part Number: RC0603FR-07470RL; RoHS: Yes; Category: Chip SMD Resistors; Stock 1: 154083; Pricing 1: 1=0.10000, 10=0.02400, 100=0.00970, 1000=0.00436, 2500=0.00378 (USD); Case/Package: 0603; Case Code (Metric): 1608; Case Code (Imperial): 0603; Min Operating Temperature: -55°C; Max Operating Temperature: 155°C; Tolerance: 1%; Resistance: 470R; Packaging: Tape and Reel; Package Quantity: 1; Resistor Type: Thick Film; Number of Terminations: 2; Termination: SMD/SMT; Max Power Dissipation: 100mW; Features: Moisture Resistant; Series: RC; Technology: THICK FILM; Resistance Tolerance: 1%; Construction: Rectangular; Length: 1.6mm; Width: 0.031inch; Height: 0.022inch; Depth: 0.8mm; RoHS Compliant: Yes; REACH SVHC: No SVHC; Military Standard: Not; Lead Free: Lead Free; ComponentLink1URL: https://datasheet.ciiva.com/11808/0900766b80f96399-11808177.pdf?src-supplier=RSComponents; ComponentLink1Description: https://datasheet.ciiva.com/11808/0900766b80f96399-11808177.pdf?src-supplier=RSComponents; ComponentLink2URL: https://datasheet.ciiva.com/7746/1738695-7746359.pdf?src-supplier=Element14; ComponentLink2Description: https://datasheet.ciiva.com/7746/1738695-7746359.pdf?src-supplier=Element14; ComponentLink3URL: https://datasheet.ciiva.com/7746/1738695-7746360.pdf?src-supplier=Element14; ComponentLink3Description: https://datasheet.ciiva.com/7746/1738695-7746360.pdf?src-supplier=Element14; ComponentLink4URL: https://datasheet.ciiva.com/7660/1868787-7660793.pdf?src-supplier=Element14; ComponentLink4Description: https://datasheet.ciiva.com/7660/1868787-7660793.pdf?src-supplier=Element14; ComponentLink5URL: https://datasheet.ciiva.com/46440/1868787-46440907.pdf?src-supplier=Element14; ComponentLink5Description: https://datasheet.ciiva.com/46440/1868787-46440907.pdf?src-supplier=Element14; ComponentLink6URL: https://datasheet.ciiva.com/2454/pyu-r-int-thick-7-2454012.pdf?src-supplier=Digi-Key; ComponentLink6Description: https://datasheet.ciiva.com/2454/pyu-r-int-thick-7-2454012.pdf?src-supplier=Digi-Key; ComponentLink7URL: https://datasheet.ciiva.com/2454/pyu-r-int-thick-7-2454013.pdf?src-supplier=Digi-Key; ComponentLink7Description: https://datasheet.ciiva.com/2454/pyu-r-int-thick-7-2454013.pdf?src-supplier=Digi-Key; ComponentLink8URL: https://datasheet.ciiva.com/2454/pyu-r-int-thick-7-2454014.pdf?src-supplier=Digi-Key; ComponentLink8Description: https://datasheet.ciiva.com/2454/pyu-r-int-thick-7-2454014.pdf?src-supplier=Digi-Key; Supplier Part Number 1: 311-470HRCT-ND; LCSC Part Number: C114669
R50 = ARG06BTC2500: ±0.1% 250Ω 1206 Chip Resistor - Surface Mount ROHS; Manufacturer: Viking Tech; Manufacturer Part Number: ARG06BTC2500; Package: 1206; LCSC Part Number: C3033906; Item Type: Resistor; ComponentLink1Description: LCSC; ComponentLink1URL: https://www.lcsc.com/product-detail/Chip-Resistor-Surface-Mount_Viking-Tech-ARG06BTC2500_C3033906.html
R51 = RT0603BRD073K3L: RES SMD 3.3K OHM 0.1% 1/10W 0603; Manufacturer: Yageo; Resistance: 3.3kR; Power Rating: 100mW; Voltage Rating: 75V; Temperature Coefficient: 25ppm/°C; Voltage Rating (DC): 50V; Item Type: Resistor; Supplier 1: Arrow Electronics; Manufacturer Part Number: RT0603BRD073K3L; RoHS: Yes; Category: Chip SMD Resistors; Stock 1: 2417; Pricing 1: 1=0.30610, 10=0.21080, 25=0.17430, 100=0.09180, 250=0.09000, 500=0.07600, 1000=0.04220 (USD); Case/Package: 0603; Case Code (Metric): 1608; Case Code (Imperial): 0603; Contact Plating: Tin,Lead; Min Operating Temperature: -55°C; Max Operating Temperature: 125°C; Package Quantity: 5000; Packaging: Tape and Reel; Tolerance: 0.1%; Resistor Type: Thin Film; Number of Terminations: 2; Termination: SMD/SMT; Max Power Dissipation: 100mW; Features: Moisture Resistant; Series: RT; Construction: Rectangular; Length: 0.063inch; Width: 0.031inch; Height: 0.022inch; Depth: 0.8mm; Military Standard: Not; Lead Free: Lead Free; RoHS Compliant: Yes; ComponentLink1URL: https://datasheet.ciiva.com/11814/0900766b8027bd26-11814026.pdf?src-supplier=Rs; ComponentLink1Description: https://datasheet.ciiva.com/11814/0900766b8027bd26-11814026.pdf?src-supplier=Rs; ComponentLink2URL: https://datasheet.ciiva.com/12694/pyu-rt-1-to-0-05-rohs-l-4-12694839.pdf?src-supplier=Mouser; ComponentLink2Description: https://datasheet.ciiva.com/12694/pyu-rt-1-to-0-05-rohs-l-4-12694839.pdf?src-supplier=Mouser; ComponentLink3URL: https://datasheet.ciiva.com/2585/pyu-rt-1-to-0-05-rohs-l-4-2585926.pdf?src-supplier=Digi-Key; ComponentLink3Description: https://datasheet.ciiva.com/2585/pyu-rt-1-to-0-05-rohs-l-4-2585926.pdf?src-supplier=Digi-Key; Supplier Part Number 1: RT0603BRD073K3L; LCSC Part Number: C309653
R52 R55 = RC0603FR-07680RL: RES SMD 680 OHM 1% 1/10W 0603; Manufacturer: Yageo; Item Type: Resistor; Manufacturer Part Number: RC0603FR-07680RL; Package: 0603; ComponentLink4URL: https://www.lcsc.com/product-detail/Chip-Resistor-Surface-Mount_YAGEO-RC0603FR-07680RL_C112310.html; ComponentLink4Description: LCSC; LCSC Part Number: C112310
R54 = RT0603BRB072K2L: RES SMD 2.2K OHM 0.1% 1/10W 0603; Manufacturer: Yageo; Value: 2.2kR; Max Power Dissipation: 100mW; Temperature Coefficient: 10ppm/°C; Item Type: Resistor; Supplier: Digi-Key; Supplier Part Number: YAG2182CT-ND; Manufacturer Part Number: RT0603BRB072K2L; RoHS: Yes; Category: Chip SMD Resistors; Stock: 518; Pricing: 1=0.6, 10=0.446, 50=0.3148, 100=0.2597, 500=0.1836, 1000=0.14563 (USD); Case/Package: 0603; Case Code (Metric): 1608; Case Code (Imperial): 0603; Min Operating Temperature: -55°C; Max Operating Temperature: 155°C; Packaging: Cut Tape; Number of Terminations: 2; Tolerance: 0.1%; Series: RT; RoHS Compliant: Yes; ComponentLink1URL: http://www.yageo.com/documents/recent/PYu-RT_1-to-0.01_RoHS_L_7.pdf?src-supplier=Digi-Key; ComponentLink1Description: http://www.yageo.com/documents/recent/PYu-RT_1-to-0.01_RoHS_L_7.pdf?src-supplier=Digi-Key; ComponentLink2URL: http://www.yageo.com/documents/recent/PYu-RT_1-to-0.01_RoHS_L_9.pdf?src-supplier=Digi-Key; ComponentLink2Description: http://www.yageo.com/documents/recent/PYu-RT_1-to-0.01_RoHS_L_9.pdf?src-supplier=Digi-Key; LCSC Part Number: C860297
SB1 = Solder Bridge: Solder Bridge ON
SW1 = TL3301NF160QG: SWITCH TACTILE SPST-NO 0.05A 12V; Manufacturer: E-Switch; Manufacturer Part Number: TL3301NF160QG/TR; Value: Custom; Package: SMD (6.00mm x 6.00mm); LCSC Part Number: C273526; ComponentLink1Description: LCSC; ComponentLink1URL: https://www.lcsc.com/product-detail/Tactile-Switches_E-Switch-TL3301NF160QG_C273526.html
U12 = ATMEGA2560-16AU: IC MCU 8BIT 256KB FLASH 100TQFP; Manufacturer: Microchip; Number of Terminals/Pins: 100; Package Body Material: Plastic; Core Architecture: AVR; Frequency: 16MHz; Interface: I2C,SPI,UART,USART,EBI/EMI,2-Wire; Number of I/Os: 86; Oscillator Type: Internal; Data Bus Width: 8b; Peripherals: PWM,Brown-out Detect/Reset,POR,WDT; Min Supply Voltage: 4.5V; Max Supply Voltage: 5.5V; Number of PWM Channels: 12; Operating Supply Voltage: 5V; RAM Size: 8KB; Number of Timers/Counters: 6; Number of ADC Channels: 16; Number of SPI Channels: 1; Watchdog Timer: Yes; Access Time: 16us; Time @ Peak Reflow Temperature-Max (s): 40s; Supplier 1: Avnet; Manufacturer Part Number: ATMEGA2560-16AU; RoHS: Yes; Category: Uncategorized; Stock 1: 4; Pricing 1: 1=12.70000 (USD); Mount: Surface Mount; Case/Package: A; Number of Pins: 100; Package Code: TFQFP; Package Shape: Square; Terminal Finish: Tin; Min Operating Temperature: -40°C; Max Operating Temperature: 85°C; Series: AVR® ATmega; Package Quantity: 90; Packaging: Tray; Memory Size: 256KB; Memory Type: FLASH; Density: 256KB; Number of Programmable I/O: 86; Max Frequency: 16MHz; Number of I2C Channels: 1; Termination: SMD/SMT; Terminal Form: Gull Wing; JESD-30 Code: S-PQFP-G100; Surface Mount: Yes; Terminal Position: QUAD; Number of I/O Lines: 86; Moisture Sensitivity Level: 3; Technology: CMOS; Peak Reflow Temperature (Cel): 260°C; Length: 14.1mm; Width: 14.1mm; Height: 1.05mm; Radiation Hardening: No; Reach SVHC Compliant: Yes; Lead Free: Lead Free; RoHS Compliant: Yes; Temperature Grade: INDUSTRIAL; ComponentLink1URL: https://datasheet.ciiva.com/22651/1698622-22651116.pdf?src-supplier=Farnell; ComponentLink1Description: https://datasheet.ciiva.com/22651/1698622-22651116.pdf?src-supplier=Farnell; ComponentLink2URL: https://datasheet.ciiva.com/15122/getdatasheetpartid-134542-15122545.pdf?src-supplier=Verical; ComponentLink2Description: https://datasheet.ciiva.com/15122/getdatasheetpartid-134542-15122545.pdf?src-supplier=Verical; ComponentLink3URL: https://datasheet.ciiva.com/29119/154804-da-01-en-atmega2560-16au-tqfp-100-29119580.pdf?src-supplier=Conrad; ComponentLink3Description: https://datasheet.ciiva.com/29119/154804-da-01-en-atmega2560-16au-tqfp-100-29119580.pdf?src-supplier=Conrad; ComponentLink4URL: https://datasheet.ciiva.com/6640/atmel-2549-8-bit-avr-microcontroller-atmega640-1280-1281-2560-2561-summary-6640293.pdf?src-supplier=Digi-Key; ComponentLink4Description: https://datasheet.ciiva.com/6640/atmel-2549-8-bit-avr-microcontroller-atmega640-1280-1281-2560-2561-summary-6640293.pdf?src-supplier=Digi-Key; ComponentLink5URL: https://datasheet.ciiva.com/1162/33246-1162139.pdf?src-supplier=Farnell; ComponentLink5Description: https://datasheet.ciiva.com/1162/33246-1162139.pdf?src-supplier=Farnell; ComponentLink6URL: https://datasheet.ciiva.com/1157/1817551-1157521.pdf?src-supplier=Element14; ComponentLink6Description: https://datasheet.ciiva.com/1157/1817551-1157521.pdf?src-supplier=Element14; ComponentLink7URL: https://datasheet.ciiva.com/16936/70123980-16936268.pdf?src-supplier=Allied+Electronics; ComponentLink7Description: https://datasheet.ciiva.com/16936/70123980-16936268.pdf?src-supplier=Allied+Electronics; Supplier Part Number 1: 68T2776; LCSC Part Number: C22460; Item Type: IC
U14 U15 = TLV9301IDCKR: IC OPAMP GP 1 CIRCUIT SC70-5; Manufacturer: Texas Instruments; Supplier 1: Mouser; Manufacturer Part Number: TLV9301IDCKR; RoHS: No; Category: Amplifiers - Op Amps, Buffer, Instrumentation; Stock 1: 29098; Pricing 1: 1=0.67, 10=0.562, 50=0.562, 100=0.445, 1000=0.284, 10000=0.283 (USD); Supplier Part Number 1: 595-TLV9301IDCKR; LCSC Part Number: C4366617; Item Type: IC
X1 = X322516MLB4SI: 16MHz SMD Crystal Resonator 9pF ±10ppm ±30ppm -40℃~+85℃ SMD3225-4P Crystals ROHS; Manufacturer: Yangxing Tech; Manufacturer Part Number: X322516MLB4SI; Package: SMD3225-4P; ComponentLink1Description: LCSC; ComponentLink1URL: https://www.lcsc.com/product-detail/Crystals_Yangxing-Tech-X322516MLB4SI_C13738.html; LCSC Part Number: C13738; Item Type: Crystal